# Altium schematic sheet 10_CELL_MONITOR.SchDoc
size A3; SheetNumber: 2; SheetTotal: 4
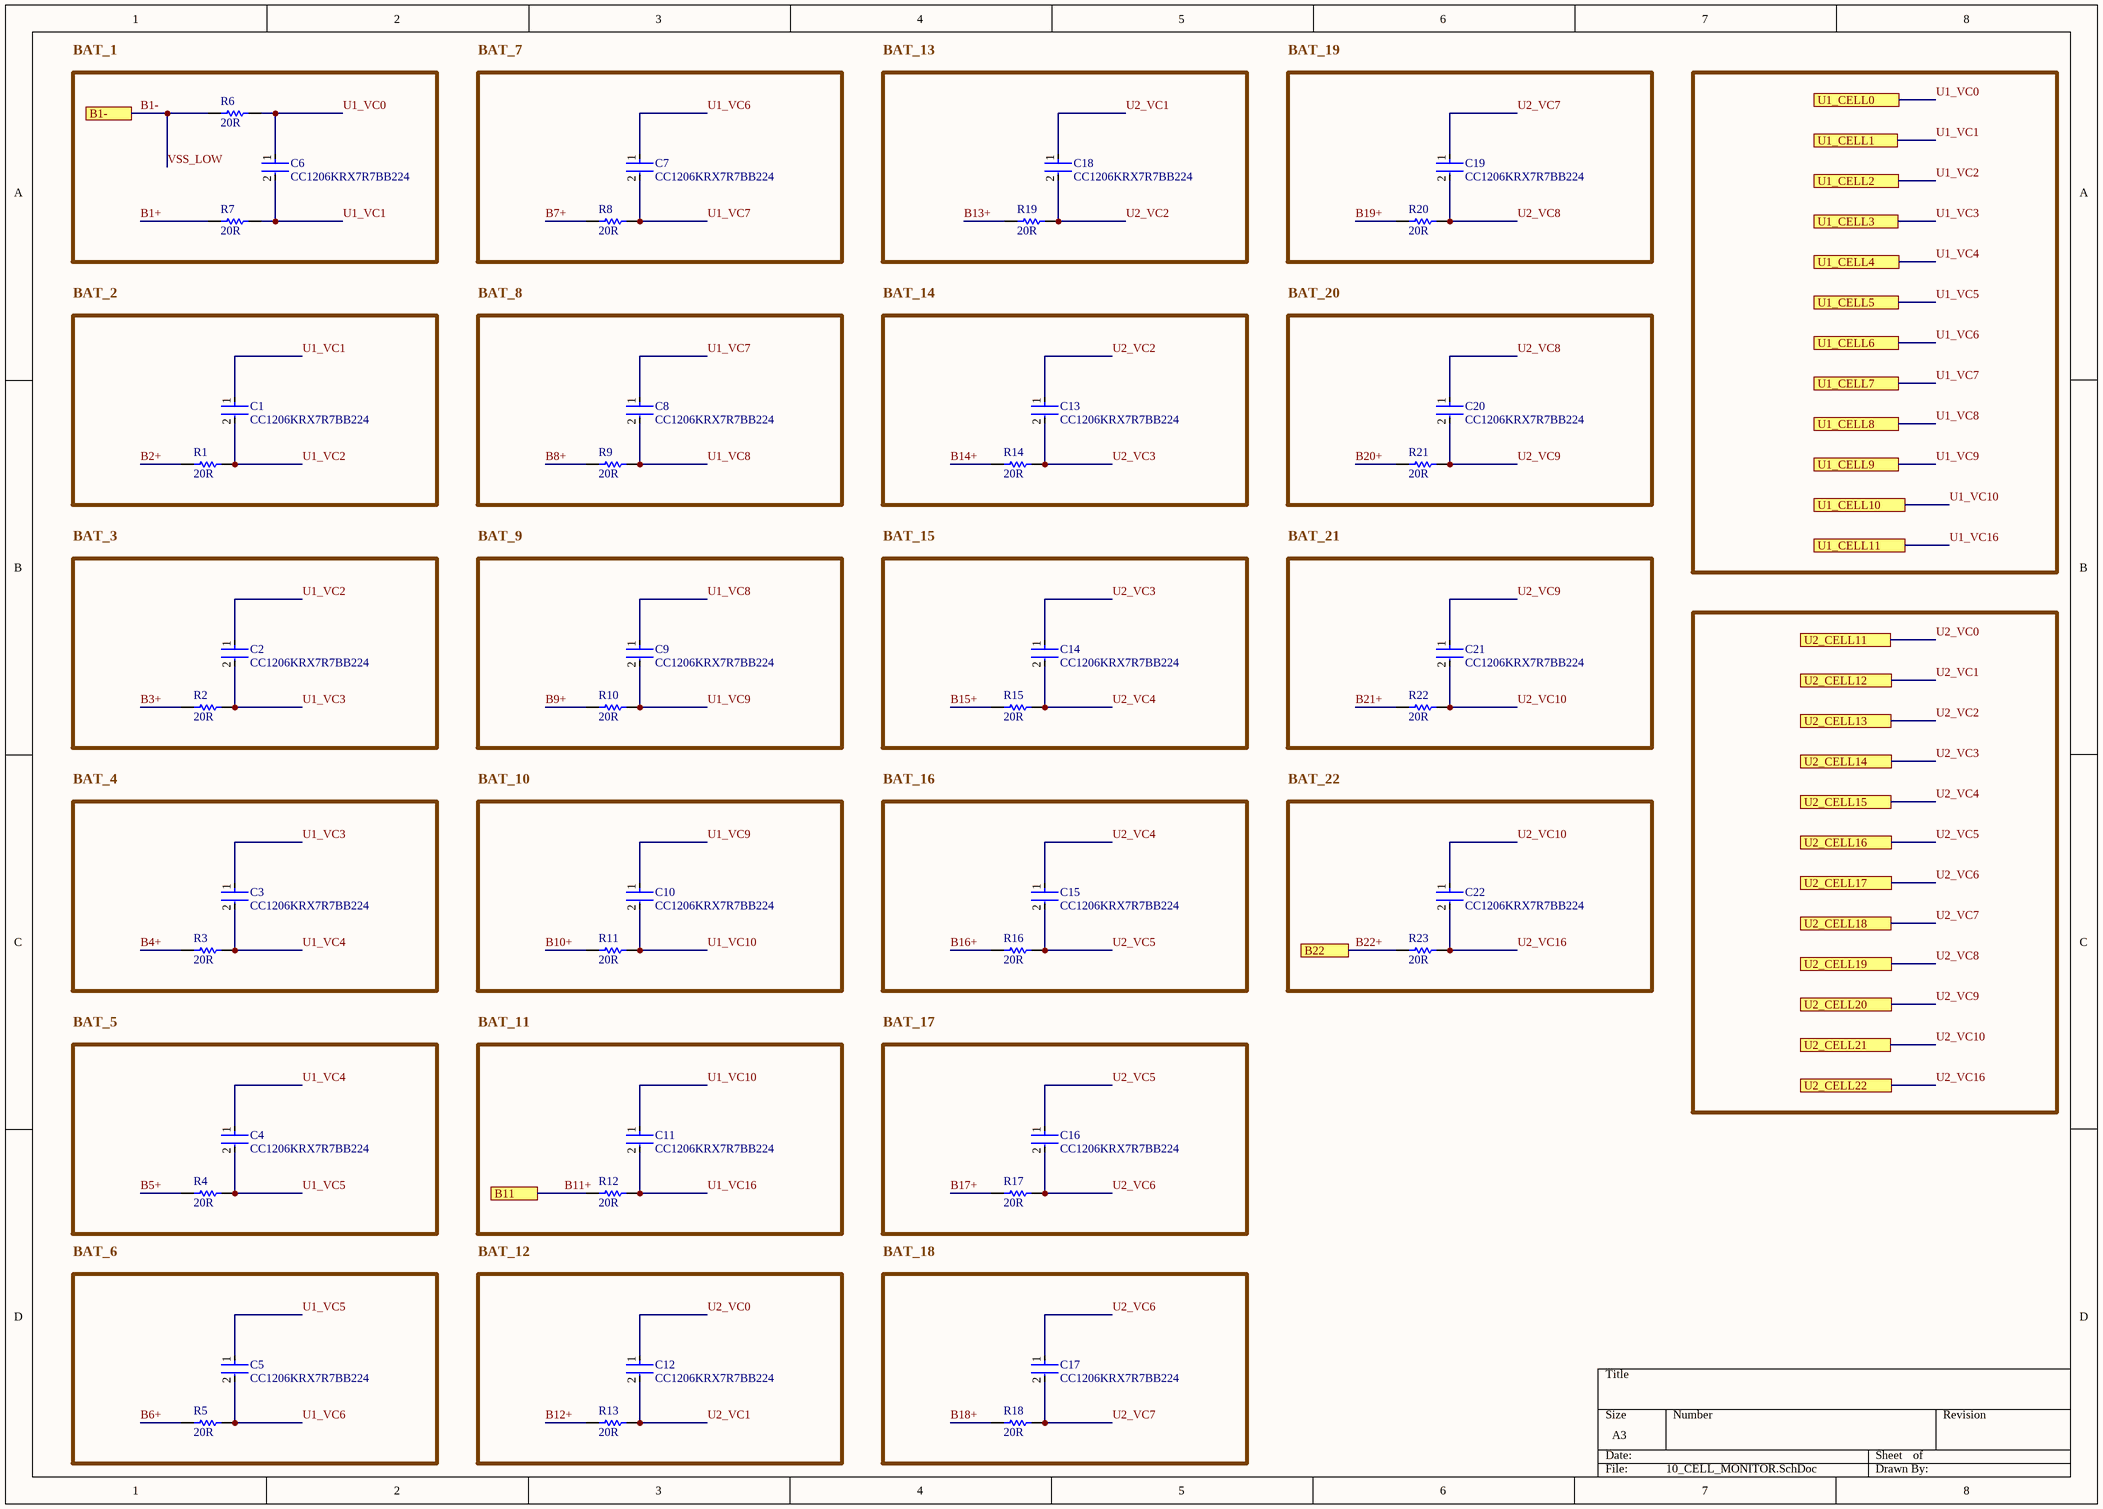
[diagram p0: 10_CELL_MONITOR.SchDoc]

## Parts
C1  CC1206KRX7R7BB224  [FP-CC1206-1_25-MFG]
C2  CC1206KRX7R7BB224  [FP-CC1206-1_25-MFG]
C3  CC1206KRX7R7BB224  [FP-CC1206-1_25-MFG]
C4  CC1206KRX7R7BB224  [FP-CC1206-1_25-MFG]
C5  CC1206KRX7R7BB224  [FP-CC1206-1_25-MFG]
C6  CC1206KRX7R7BB224  [FP-CC1206-1_25-MFG]
C7  CC1206KRX7R7BB224  [FP-CC1206-1_25-MFG]
C8  CC1206KRX7R7BB224  [FP-CC1206-1_25-MFG]
C9  CC1206KRX7R7BB224  [FP-CC1206-1_25-MFG]
C10  CC1206KRX7R7BB224  [FP-CC1206-1_25-MFG]
C11  CC1206KRX7R7BB224  [FP-CC1206-1_25-MFG]
C12  CC1206KRX7R7BB224  [FP-CC1206-1_25-MFG]
C13  CC1206KRX7R7BB224  [FP-CC1206-1_25-MFG]
C14  CC1206KRX7R7BB224  [FP-CC1206-1_25-MFG]
C15  CC1206KRX7R7BB224  [FP-CC1206-1_25-MFG]
C16  CC1206KRX7R7BB224  [FP-CC1206-1_25-MFG]
C17  CC1206KRX7R7BB224  [FP-CC1206-1_25-MFG]
C18  CC1206KRX7R7BB224  [FP-CC1206-1_25-MFG]
C19  CC1206KRX7R7BB224  [FP-CC1206-1_25-MFG]
C20  CC1206KRX7R7BB224  [FP-CC1206-1_25-MFG]
C21  CC1206KRX7R7BB224  [FP-CC1206-1_25-MFG]
C22  CC1206KRX7R7BB224  [FP-CC1206-1_25-MFG]
R1  20R  [RESC3116X65X40LL10T20]
R2  20R  [RESC3116X65X40LL10T20]
R3  20R  [RESC3116X65X40LL10T20]
R4  20R  [RESC3116X65X40LL10T20]
R5  20R  [RESC3116X65X40LL10T20]
R6  20R  [RESC3116X65X40LL10T20]
R7  20R  [RESC3116X65X40LL10T20]
R8  20R  [RESC3116X65X40LL10T20]
R9  20R  [RESC3116X65X40LL10T20]
R10  20R  [RESC3116X65X40LL10T20]
R11  20R  [RESC3116X65X40LL10T20]
R12  20R  [RESC3116X65X40LL10T20]
R13  20R  [RESC3116X65X40LL10T20]
R14  20R  [RESC3116X65X40LL10T20]
R15  20R  [RESC3116X65X40LL10T20]
R16  20R  [RESC3116X65X40LL10T20]
R17  20R  [RESC3116X65X40LL10T20]
R18  20R  [RESC3116X65X40LL10T20]
R19  20R  [RESC3116X65X40LL10T20]
R20  20R  [RESC3116X65X40LL10T20]
R21  20R  [RESC3116X65X40LL10T20]
R22  20R  [RESC3116X65X40LL10T20]
R23  20R  [RESC3116X65X40LL10T20]

## Ports
B1-, B11, B22, U1_CELL0, U1_CELL1, U1_CELL2, U1_CELL3, U1_CELL4, U1_CELL5, U1_CELL6, U1_CELL7, U1_CELL8, U1_CELL9, U1_CELL10, U1_CELL11, U2_CELL11, U2_CELL12, U2_CELL13, U2_CELL14, U2_CELL15, U2_CELL16, U2_CELL17, U2_CELL18, U2_CELL19, U2_CELL20, U2_CELL21, U2_CELL22

## Nets
B1+: R7.1
B1-: R6.1 ; port B1-  [also labelled VSS_LOW]
B2+: R1.1
B3+: R2.1
B4+: R3.1
B5+: R4.1
B6+: R5.1
B7+: R8.1
B8+: R9.1
B9+: R10.1
B10+: R11.1
B11+: R12.1 ; port B11
B12+: R13.1
B13+: R19.1
B14+: R14.1
B15+: R15.1
B16+: R16.1
B17+: R17.1
B18+: R18.1
B19+: R20.1
B20+: R21.1
B21+: R22.1
B22+: R23.1 ; port B22
U1_VC0: C6.1 R6.2 ; port U1_CELL0
U1_VC1: C1.1 C6.2 R7.2 ; port U1_CELL1
U1_VC2: C1.2 C2.1 R1.2 ; port U1_CELL2
U1_VC3: C2.2 C3.1 R2.2 ; port U1_CELL3
U1_VC4: C3.2 C4.1 R3.2 ; port U1_CELL4
U1_VC5: C4.2 C5.1 R4.2 ; port U1_CELL5
U1_VC6: C5.2 C7.1 R5.2 ; port U1_CELL6
U1_VC7: C7.2 C8.1 R8.2 ; port U1_CELL7
U1_VC8: C8.2 C9.1 R9.2 ; port U1_CELL8
U1_VC9: C9.2 C10.1 R10.2 ; port U1_CELL9
U1_VC10: C10.2 C11.1 R11.2 ; port U1_CELL10
U1_VC16: C11.2 R12.2 ; port U1_CELL11
U2_VC0: C12.1 ; port U2_CELL11
U2_VC1: C12.2 C18.1 R13.2 ; port U2_CELL12
U2_VC2: C13.1 C18.2 R19.2 ; port U2_CELL13
U2_VC3: C13.2 C14.1 R14.2 ; port U2_CELL14
U2_VC4: C14.2 C15.1 R15.2 ; port U2_CELL15
U2_VC5: C15.2 C16.1 R16.2 ; port U2_CELL16
U2_VC6: C16.2 C17.1 R17.2 ; port U2_CELL17
U2_VC7: C17.2 C19.1 R18.2 ; port U2_CELL18
U2_VC8: C19.2 C20.1 R20.2 ; port U2_CELL19
U2_VC9: C20.2 C21.1 R21.2 ; port U2_CELL20
U2_VC10: C21.2 C22.1 R22.2 ; port U2_CELL21
U2_VC16: C22.2 R23.2 ; port U2_CELL22

## Notes on the sheet
- Labels drawn without touching a wire or pin: BAT_1, BAT_2, BAT_3, BAT_4, BAT_5, BAT_6, BAT_7, BAT_8, BAT_9, BAT_10, BAT_11, BAT_12, BAT_13, BAT_14, BAT_15, BAT_16, BAT_17, BAT_18, BAT_19, BAT_20, BAT_21, BAT_22

## Library data of the parts
C1-C22 = CMP-1037-04366-2: CAP CER 0.22UF 16V X7R 1206; Manufacturer: Yageo; Automotive Grade: NA; Temperature Coefficient: 15%; Tolerance: 0.1; Value: 220 nF; Material: Ceramic; Temperature Range High: +125°C; Device Class L1: Passive Components; Octopart: https://octopart.com/cc1206krx7r7bb224-yageo-42522915; Automotive: No; Package: CC1206-1.25; Digikey Description: CAP CER 0.22UF 16V X7R 1206; RoHS: TRUE; Temperature Range Low: -55°C; Device Class L2: Capacitors; Manufacturer Part Number: CC1206KRX7R7BB224; Height: 1.45mm; Footprint Url: http://www.yageo.com/exep/pages/download/literatures/UPY-C_GEN_24.pdf; Temperature Characteristic: X7R; ComponentLink2URL: http://www.yageo.com/documents/recent/UPY-NP0X7R_HV_1KV-to-3KV_11.pdf; ComponentLink2Description: Datasheet; Mouser Description: Multilayer Ceramic Capacitors MLCC - SMD/SMT 220nF 16V X7R 10%; Voltage Rating: 16 V; Lead Free: Yes; Temperature: -55°C to +125°C; Capacitance: 220 nF; Category: Cap; Device Class L3: Ceramic Capacitors
R1-R23 = CMP-2003-04964-1: Part Number: RT1206FRE0720RL; Manufacturer: Yageo